# EasyEDA Pro project EVA_RT.eprj, board EVA_RT_PCB
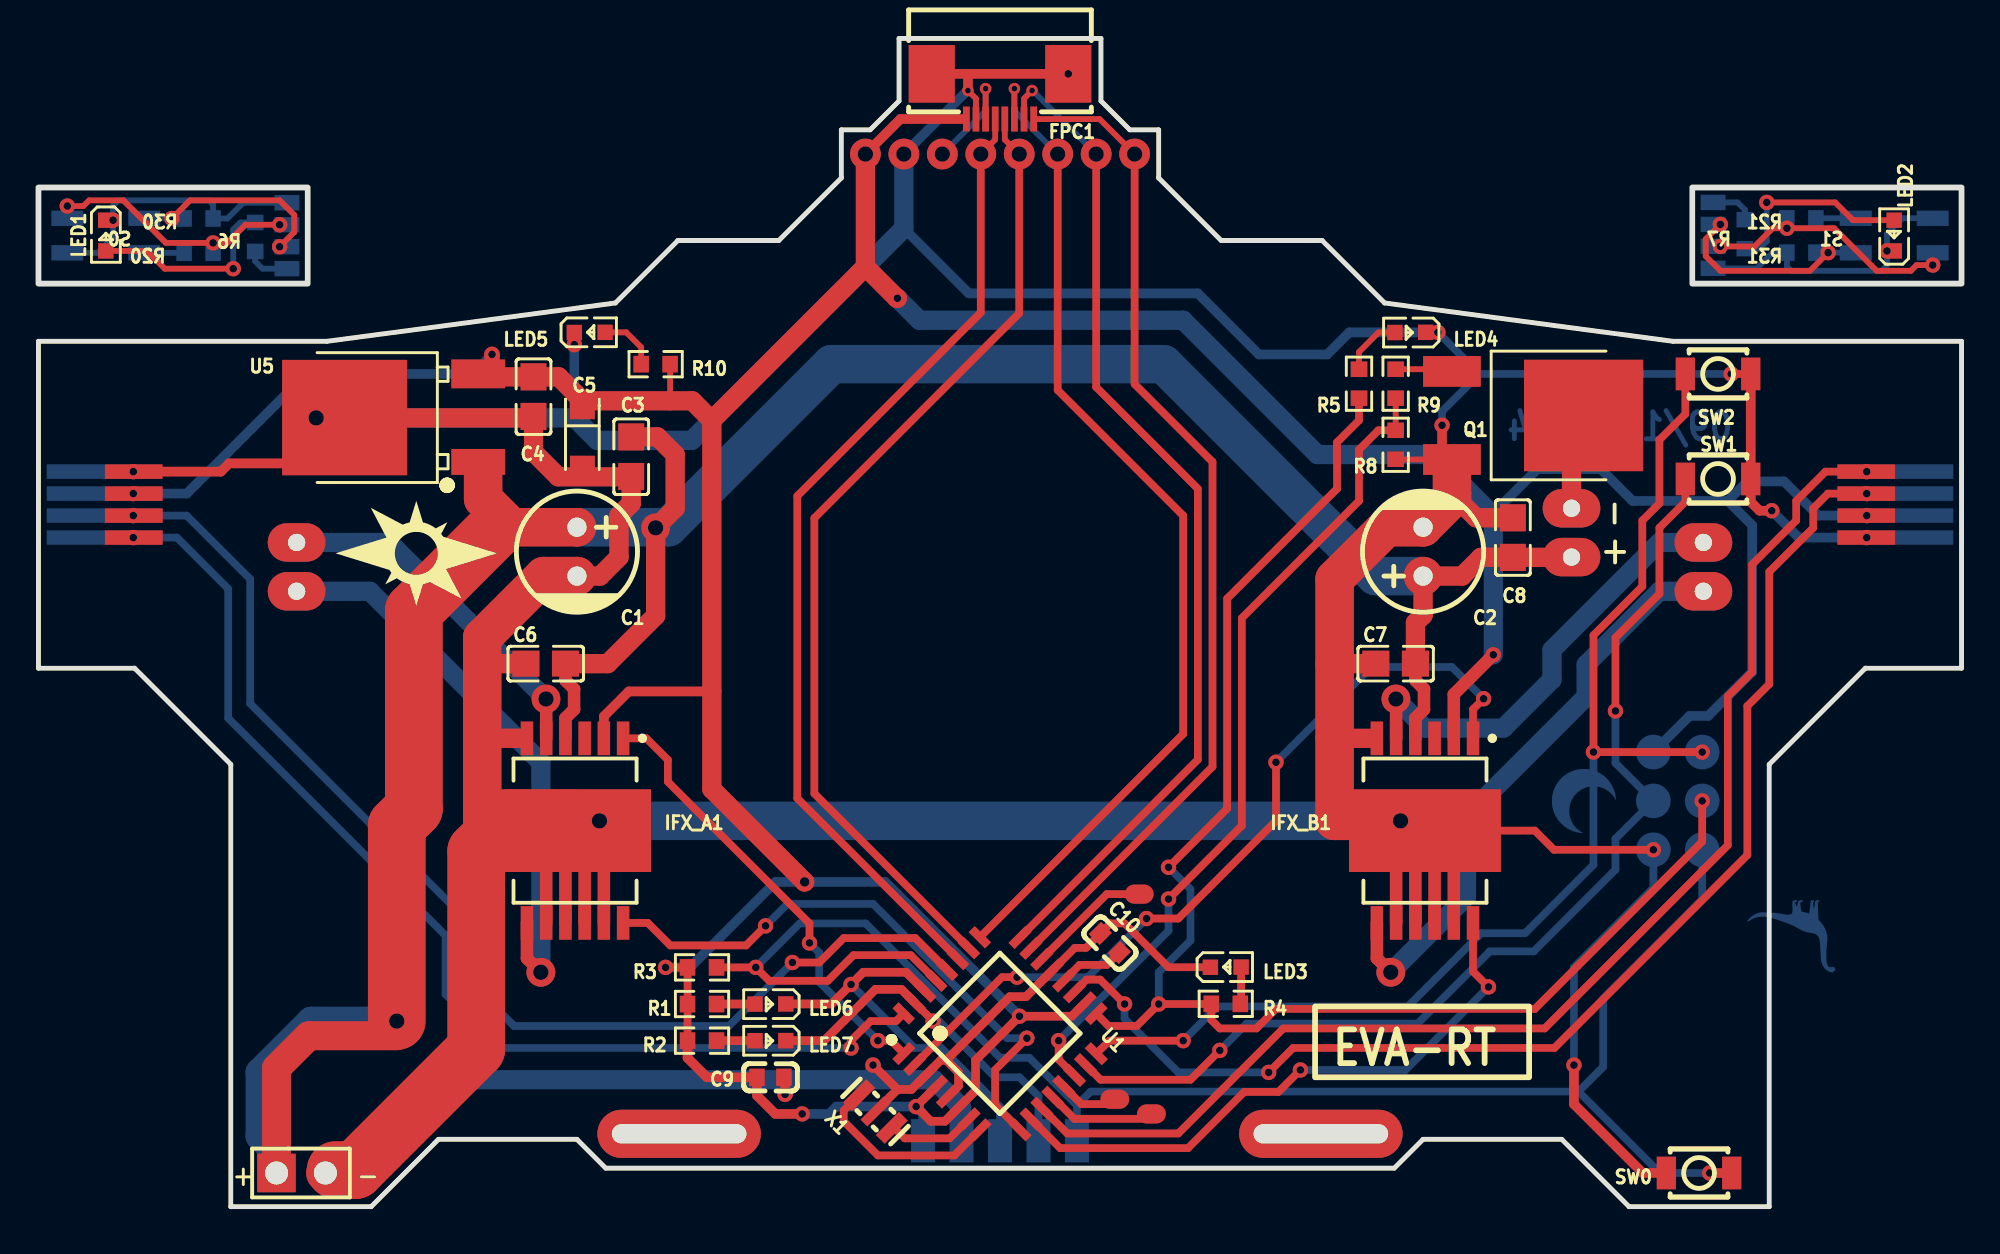
[diagram p12: board, top side]
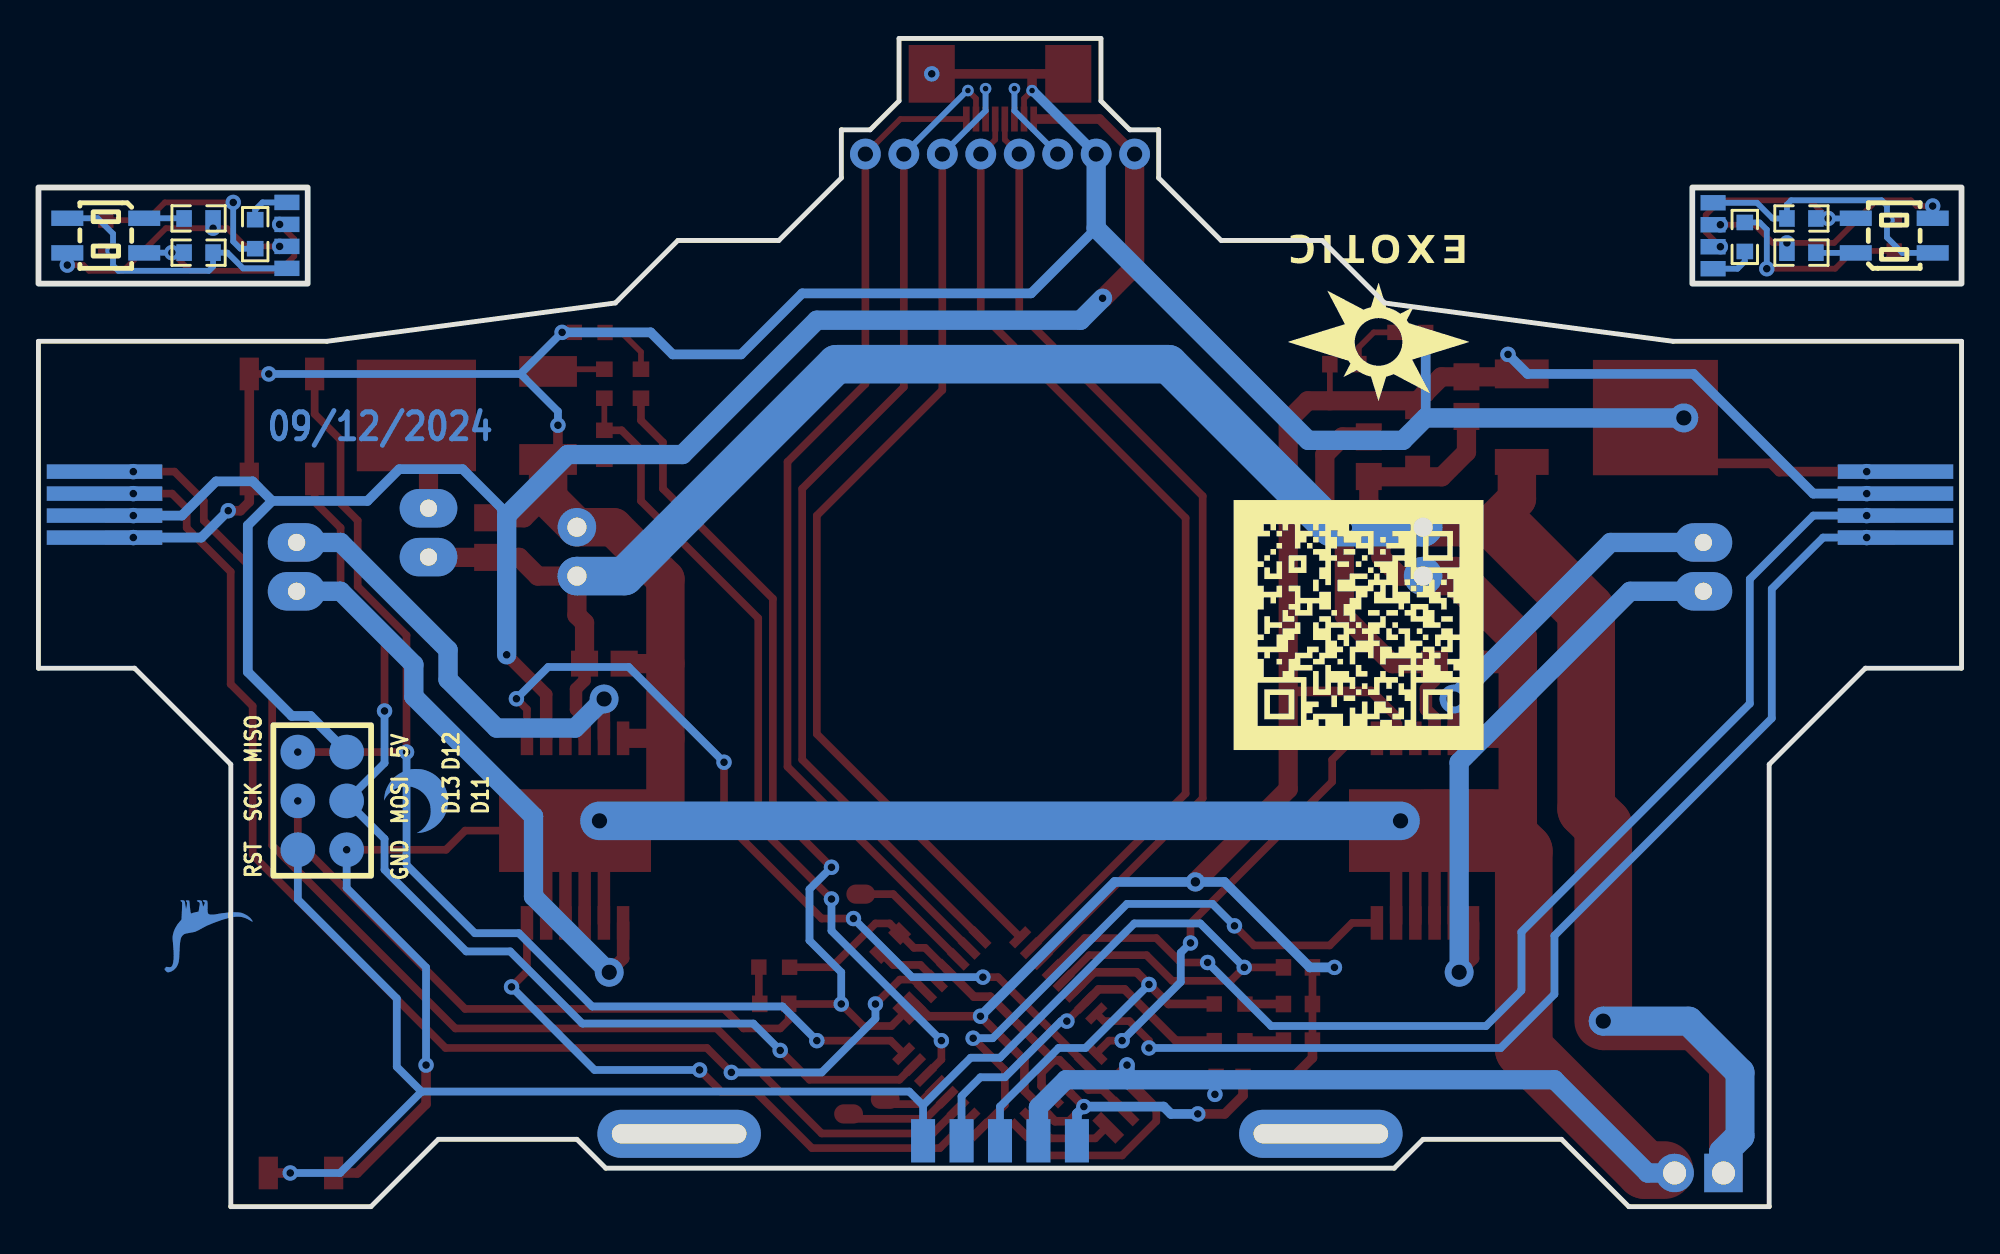
[diagram p13: board, bottom side, seen from below]

Outline 100 x 60.75 mm; copper layers: Top Layer, Bottom Layer. Coordinates in mm from the lower left corner of the outline.
Outline path: rectangle 0,53 14,48 ; rectangle 100,48 86,53 ; 0,45 15,45 30,46.99 33.25,50.24 38.5,50.24 41.75,53.49 41.75,56 43.25,56 44.75,57.5 44.75,60.75 55.25,60.75 55.25,57.5 56.75,56 58.25,56 58.25,53.49 61.5,50.24 66.75,50.24 70,46.99 85,45 100,45 100,28 95,28 90,23 90,0 82.71,0 79.21,3.5 72,3.5 70.5,2 29.5,2 28,3.5 20.8,3.5 17.3,0 10,0 10,23 5,28 0,28 0,45
Stack: Top Layer 0.035mm - / Dielectric2 1.51mm FR4 er 4.5 / Bottom Layer 0.035mm -

## Design rules (mm)
template: Custom Config
spacing copperThickness1oz (default): track to track 0.102, other pairs 0.152 to 0.3
spacing copperThickness2oz: track to track 0.203, other pairs 0.152 to 0.3
track width copperThickness1oz (default): min 0.127, default 0.254, max 3
track width copperThickness2oz: min 0.203, default 0.254, max 2.54
differential pair differentialPair (default): width min 0.127, default 0.254, max 2.54; gap min 0.152, default 0.152
via viaSize (default): diameter min 0.5, default 0.61, max 10; hole min 0.3, default 0.305, max 6.3

## Placement (name value [footprint] x y rotation side)
C1  220uF  [cap-th_bd6.3-p2.50-d1.0-fd]  28 34.06 270 top
C2  220uF  [cap-th_bd6.3-p2.50-d1.0-fd]  72 34.06 90 top
C3  220nF  [C0805]  30.82 39 90 top
C4  100nF  [C0805]  25.74 42.12 90 top
C5  47uF  [cap-smd_l3.2-w1.6-rd]  28.28 40 270 top
C6  100nF  [C0805]  26.38 28.24 0 top
C7  100nF  [C0805]  70.57 28.24 0 top
C8  100nF  [C0805]  76.67 34.79 270 top
C9  100nF  [C0603]  38.06 6.73 180 top
C10  100nF  [C0603]  55.72 13.71 135 top
FPC1  FFC05001-08SBA124W5M  [FFC-SMD_FFC05001-08SBA124W5M]  50 57.73 180 top
IFX_A1  -  [PG-DSO-12-17]  27.9 19.55 270 top
IFX_B1  -  [PG-DSO-12-17]  72.1 19.55 270 top
LED1  XL-1608SURC-06  [LED0603-RD_RED]  3.5 50.5 270 top
LED2  XL-1608SURC-06  [LED0603-RD_RED]  96.5 50.5 90 top
LED3  XL-1608SURC-06  [LED0603-RD_RED]  61.74 12.45 0 top
LED4  XL-1608SURC-06  [LED0603-RD_RED]  71.34 45.46 180 top
LED5  XL-1608SURC-06  [LED0603-RD_RED]  28.66 45.46 0 top
LED6  XL-1608SURC-06  [LED0603-RD_RED]  38.06 10.54 180 top
LED7  XL-1608SURC-06  [LED0603-RD_RED]  38.06 8.63 180 top
NOREF  -  [Pad_e1501]  96.57 35.94 90 top
NOREF#2  -  [Pad_e285]  83.97 23.64 0 top
NOREF#3  -  [Pad_e92]  4.96 37.08 90 top
NOREF#4  -  [Pad_e1096]  87.08 51.08 90 top
NOREF#5  -  [Pad_e19]  52 3.43 0 top
NOREF#6  -  [Pad_e7]  48 3.43 0 top
NOREF#7  -  [Pad_e48]  95.04 34.79 90 top
NOREF#8  -  [Pad_e89]  95.04 35.94 90 top
NOREF#9  -  [Pad_e174]  79.72 36.32 0 top
NOREF#10  -  [Pad_e1503]  96.57 38.22 90 top
NOREF#11  -  [Pad_e747]  86.58 32 0 top
NOREF#12  -  [Pad_e8]  46 3.43 0 top
NOREF#13  -  [Pad_e164]  79.72 33.78 0 top
NOREF#14  -  [Pad_e746]  86.58 34.54 0 top
NOREF#15  -  [Pad_e284]  83.97 21.1 180 top
NOREF#16  -  [Pad_e5]  66.69 3.79 270 top
NOREF#17  -  [Pad_e91]  4.96 38.22 90 top
NOREF#18  -  [Pad_e280]  86.51 23.64 180 top
NOREF#19  -  [Pad_e46]  95.04 37.08 90 top
NOREF#20  -  [Pad_e34]  54 3.43 0 top
NOREF#21  -  [Pad_e1018]  12.92 48.78 270 top
NOREF#22  -  [Pad_e1500]  96.57 34.79 90 top
NOREF#23  -  [Pad_e1149]  87.08 48.79 90 top
NOREF#24  -  [Pad_e535]  57.24 16.25 90 top
NOREF#25  -  [Pad_e16]  50 3.43 0 top
NOREF#26  -  [Pad_e98]  3.43 37.08 90 top
NOREF#27  -  [Pad_e93]  4.96 35.94 90 top
NOREF#28  -  [Pad_e1502]  96.57 37.08 90 top
NOREF#29  -  [Pad_e282]  86.51 18.56 180 top
NOREF#30  -  [Pad_e713]  57.87 4.82 90 top
NOREF#31  -  [Pad_e868]  13.42 32 180 top
NOREF#32  -  [Pad_e712]  55.97 5.58 90 top
NOREF#33  -  [Pad_e1021]  12.92 52.21 270 top
NOREF#34  -  [Pad_e96]  3.43 34.79 90 top
NOREF#35  -  [Pad_e869]  13.42 34.54 180 top
NOREF#36  -  [Pad_e1094]  87.08 52.22 90 top
NOREF#37  -  [Pad_e281]  86.51 21.1 90 top
NOREF#38  -  [Pad_e283]  83.97 18.56 180 top
NOREF#39  -  [Pad_e45]  95.04 38.22 90 top
NOREF#40  -  [Pad_e13]  33.31 3.79 270 top
NOREF#41  -  [Pad_e100]  3.43 38.22 90 top
NOREF#42  -  [Pad_e1028]  12.92 49.92 270 top
NOREF#43  -  [Pad_e97]  3.43 35.94 90 top
NOREF#44  -  [Pad_e90]  4.96 34.79 90 top
NOREF#45  -  [Pad_e1095]  87.08 49.94 90 top
NOREF#46  -  [Pad_e1027]  12.92 51.06 270 top
Q1  IRFR3411TR-VB  [TO-252-2_L6.6-W6.1-P4.57-LS9.9-BR-CW]  76.92 41.14 180 top
R1  1kΩ  [R0603]  34.51 10.54 0 top
R2  1kΩ  [R0603]  34.51 8.63 0 top
R3  1kΩ  [R0603]  34.51 12.44 0 top
R4  1kΩ  [R0603]  61.74 10.55 0 top
R5  1kΩ  [R0603]  68.67 42.8 90 top
R6  1kΩ  [R0603]  11.27 50.43 90 bottom
R7  1kΩ  [R0603]  88.73 50.57 270 bottom
R8  10kΩ  [R0603]  70.57 39.62 270 top
R9  200Ω  [R0603]  70.57 42.8 270 top
R10  1kΩ  [R0603]  32.09 43.81 0 top
R20  100Ω  [R0603]  8.33 49.61 180 bottom
R21  100Ω  [R0603]  91.67 51.39 0 bottom
R30  47kΩ  [R0603]  8.33 51.39 180 bottom
R31  47kΩ  [R0603]  91.67 49.61 0 bottom
S0  QRE1113GR  [OPTO-SMD_QRE1113GR]  3.5 50.5 180 bottom
S1  QRE1113GR  [OPTO-SMD_QRE1113GR]  96.5 50.5 0 bottom
SW0  B3U-1000P  [key-smd_b3u-1000pm]  86.35 1.75 180 top
SW1  B3U-1000P  [key-smd_b3u-1000pm]  87.34 37.84 0 top
SW2  B3U-1000P  [key-smd_b3u-1000pm]  87.34 43.3 0 top
U1  ATMEGA328P-AU  [tqfp-32_l7.0-w7.0-p0.80-ls9.0-bl]  50 9 315 top
U5  78M05  [TO-252-2_L6.5-W6.1-P4.58-LS10.0-TL]  19.39 41.02 180 top
VIN  KH-2.54PH180-1X2P-L11.5  [hdr-th_2p-p2.54-v-m]  13.65 1.75 0 top
X1  16MHz  [OSC-SMD_3P-L3.2-W1.3-P1.2-L]  43.52 4.95 135 top

## Footprints (pads in the part's own frame, mm; a bottom-side part is the same pattern mirrored in y, then rotated)
C0603
  rect 0.8x0.9 smd: 1(-0.7,0) 2(0.7,0)
C0805
  rect 1.41x1.35 smd: 1(-1.03,0) 2(1.03,0)
cap-smd_l3.2-w1.6-rd
  rect 1x1.296 smd: 1(-1.449,0) 2(1.449,0)
cap-th_bd6.3-p2.50-d1.0-fd
  round 2 hole 1x0.9: 1(-1.27,0) 2(1.27,0)
FFC-SMD_FFC05001-08SBA124W5M
  rect 0.35x1.3 smd: 1(1.75,1.175) 2(1.25,1.175) 3(0.75,1.175) 4(0.25,1.175) 5(-0.25,1.175) 6(-0.75,1.175) 7(-1.25,1.175) 8(-1.75,1.175)
  rect 2.4x3 smd: 9(-3.55,-1.175) 10(3.55,-1.175)
hdr-th_2p-p2.54-v-m
  rect 2x2 hole 1.2x0.9: 1(-1.27,0)
  round 2 hole 1.2x0.9: 2(1.27,0)
key-smd_b3u-1000pm
  rect 1x1.7 smd: 1(-1.7,0) 2(1.7,0)
LED0603-RD_RED
  rect 0.8x0.8 smd: 1(-0.799,-0.004) 2(0.799,0.004)
OPTO-SMD_QRE1113GR
  rect 1.66x0.8 smd: 1(-2,-0.9) 2(2,-0.9) 3(2,0.9) 4(-2,0.9)
OSC-SMD_3P-L3.2-W1.3-P1.2-L
  rect 0.65x1.7 smd: 1(-1.2,0) 3(1.2,0)
  rect 0.5x1.7 smd: 2(0,0)
Pad_e5
  oval 2.5x8.5 hole 1x7: 1(0,0)
Pad_e7
  rect 1.25x2.25 smd far side: 33(0,0)
Pad_e8
  rect 1.25x2.25 smd far side: 33(0,0)
Pad_e13
  oval 2.5x8.5 hole 1x7: 1(0,0)
Pad_e16
  rect 1.25x2.25 smd far side: 33(0,0)
Pad_e19
  rect 1.25x2.25 smd far side: 33(0,0)
Pad_e34
  rect 1.25x2.25 smd far side: 33(0,0)
Pad_e45
  rect 0.75x3 smd: 1(0,0)
Pad_e46
  rect 0.75x3 smd: 1(0,0)
Pad_e48
  rect 0.75x3 smd: 1(0,0)
Pad_e89
  rect 0.75x3 smd: 1(0,0)
Pad_e90
  rect 0.75x3 smd: 1(0,0)
Pad_e91
  rect 0.75x3 smd: 1(0,0)
Pad_e92
  rect 0.75x3 smd: 1(0,0)
Pad_e93
  rect 0.75x3 smd: 1(0,0)
Pad_e96
  rect 0.75x6 smd far side: 1(0,0)
Pad_e97
  rect 0.75x6 smd far side: 1(0,0)
Pad_e98
  rect 0.75x6 smd far side: 1(0,0)
Pad_e100
  rect 0.75x6 smd far side: 1(0,0)
Pad_e164
  oval 3x2 hole 0.9: 1(0,0)
Pad_e174
  oval 3x2 hole 0.9: 1(0,0)
Pad_e280
  round 1.8 smd far side: 1(0,0)
Pad_e281
  round 1.8 smd far side: 1(0,0)
Pad_e282
  round 1.8 smd far side: 1(0,0)
Pad_e283
  round 1.8 smd far side: 1(0,0)
Pad_e284
  round 1.8 smd far side: 1(0,0)
Pad_e285
  round 1.8 smd far side: 1(0,0)
Pad_e535
  oval 1x1.5 smd: 1(0,0)
Pad_e712
  oval 1x1.5 smd: 1(0,0)
Pad_e713
  oval 1x1.5 smd: 1(0,0)
Pad_e746
  oval 3x2 hole 0.9: 1(0,0)
Pad_e747
  oval 3x2 hole 0.9: 1(0,0)
Pad_e868
  oval 3x2 hole 0.9: 1(0,0)
Pad_e869
  oval 3x2 hole 0.9: 1(0,0)
Pad_e1018
  rect 0.8x1.3 smd far side: 1(0,0)
Pad_e1021
  rect 0.8x1.3 smd far side: 1(0,0)
Pad_e1027
  rect 0.8x1.3 smd far side: 1(0,0)
Pad_e1028
  rect 0.8x1.3 smd far side: 1(0,0)
Pad_e1094
  rect 0.8x1.3 smd far side: 1(0,0)
Pad_e1095
  rect 0.8x1.3 smd far side: 1(0,0)
Pad_e1096
  rect 0.8x1.3 smd far side: 1(0,0)
Pad_e1149
  rect 0.8x1.3 smd far side: 1(0,0)
Pad_e1500
  rect 0.75x6 smd far side: 1(0,0)
Pad_e1501
  rect 0.75x6 smd far side: 1(0,0)
Pad_e1502
  rect 0.75x6 smd far side: 1(0,0)
Pad_e1503
  rect 0.75x6 smd far side: 1(0,0)
PG-DSO-12-17
  rect 1.75x0.65 smd: 1(-4.8,2.5) 2(-4.8,1.5) 3(-4.8,0.5) 4(-4.8,-0.5) 5(-4.8,-1.5) 6(-4.8,-2.5) 7(4.8,-2.5) 8(4.8,-1.5) 9(4.8,-0.5) 10(4.8,0.5) 11(4.8,1.5) 12(4.8,2.5)
  rect 4.3x7.9 smd: 13(0,0)
R0603
  rect 0.806x0.864 smd: 1(-0.753,0) 2(0.753,0)
TO-252-2_L6.5-W6.1-P4.58-LS10.0-TL
  rect 2.8x1.35 smd: 1(-3.475,2.29)
  rect 2.8x1.5 smd: 3(-3.475,-2.29)
  rect 6.5x6 smd: 4(3.475,-0.017)
TO-252-2_L6.6-W6.1-P4.57-LS9.9-BR-CW
  rect 3x1.6 smd: 1(3.424,-2.29) 3(3.424,2.29)
  rect 6.2x5.8 smd: 2(-3.424,0)
tqfp-32_l7.0-w7.0-p0.80-ls9.0-bl
  rect 0.45x1.25 smd: 1(-2.8,-4.269) 2(-2,-4.269) 3(-1.2,-4.269) 4(-0.4,-4.269) 5(0.4,-4.269) 6(1.2,-4.269) 7(2,-4.269) 8(2.8,-4.269) 17(2.8,4.269) 18(2,4.269) 19(1.2,4.269) 20(0.4,4.269) 21(-0.4,4.269) 22(-1.2,4.269) 23(-2,4.269) 24(-2.8,4.269)
  rect 1.25x0.45 smd: 9(4.282,-2.8) 10(4.282,-2) 11(4.282,-1.2) 12(4.282,-0.4) 13(4.282,0.4) 14(4.282,1.2) 15(4.282,2) 16(4.282,2.8)
  rect 1.2x0.45 smd: 25(-4.281,2.8) 26(-4.281,2) 27(-4.281,1.2) 28(-4.281,0.4) 29(-4.281,-0.4) 30(-4.281,-1.2) 31(-4.281,-2) 32(-4.281,-2.8)

## Nets
+5V: C4.2 C5.1 C9.2 FPC1.1 IFX_A1.2 IFX_B1.2 NOREF.1 NOREF#2.1 NOREF#3.1 NOREF#8.1 NOREF#12.33 NOREF#26.1 NOREF#45.1 NOREF#46.1 R1.1 R2.1 R3.1 R10.2 R20.1 R21.1 S0.3 S1.3 U1.4 U1.6 U1.18 U5.3
GND: C1.2 C2.2 C3.1 C4.1 C5.2 C6.1 C7.1 C8.1 C9.1 C10.2 FPC1.2 FPC1.9 FPC1.10 IFX_A1.6 IFX_A1.8 IFX_A1.9 IFX_A1.10 IFX_A1.11 IFX_A1.13 IFX_B1.6 IFX_B1.8 IFX_B1.9 IFX_B1.10 IFX_B1.11 IFX_B1.13 LED1.1 LED2.1 LED3.1 LED4.1 LED5.1 NOREF#6.33 NOREF#7.1 NOREF#17.1 NOREF#22.1 NOREF#23.1 NOREF#33.1 NOREF#38.1 NOREF#41.1 Q1.3 R8.2 R30.1 R31.1 S0.2 S1.2 SW0.2 SW1.2 SW2.2 U1.3 U1.5 U1.21 U5.4 VIN.2 X1.2
VCC: C1.1 C2.1 C3.2 C6.2 C7.2 C8.2 IFX_A1.4 IFX_B1.4 NOREF#13.1 U5.1 VIN.1
$C10_1: C10.1 U1.20
$LED1_2: LED1.2 R6.2
$LED2_2: LED2.2 R7.2
$LED3_2: LED3.2 R4.2
$LED4_2: LED4.2 R5.2
$LED5_2: LED5.2 R10.1
$LED6_2: LED6.2 R1.2
$LED7_2: LED7.2 R2.2
$Q1_1: Q1.1 R9.1
$R20_2: R20.2 S0.1
$R21_2: R21.2 S1.1
$U1_7: U1.7 X1.1
$U1_8: U1.8 X1.3
B1/D11: NOREF#15.1 SW1.1 U1.15
B2/D12: NOREF#18.1 SW2.1 U1.16
C0/A4: FPC1.4 U1.27
DIRA/D3: IFX_A1.1 U1.1
DIRB/D4: IFX_B1.1 U1.2
LED1/D2: NOREF#21.1 NOREF#34.1 NOREF#44.1 R6.1 U1.32
LED2/D7: NOREF#10.1 NOREF#36.1 NOREF#39.1 R7.1 U1.11
LED3/D13: NOREF#37.1 R4.1 R5.1 U1.17
OUT_A1: IFX_A1.5 NOREF#35.1
OUT_A2: IFX_A1.7 NOREF#31.1
OUT_B1: IFX_B1.5 NOREF#14.1
OUT_B2: IFX_B1.7 NOREF#11.1
OUT_C: NOREF#9.1 Q1.2
P3: FPC1.3
PWMA/D5: IFX_A1.12 U1.9
PWMB/D6: IFX_B1.12 U1.10
PWMC/D10: R8.1 R9.2 U1.14
RESET: NOREF#20.33 NOREF#29.1 R3.2 SW0.1 U1.29
RX/D0: LED6.1 NOREF#25.33 U1.30
S0/A0: FPC1.8 U1.23
S1/A1: FPC1.7 U1.24
S2/A2: FPC1.6 U1.25
S3/A3: FPC1.5 U1.26
TX/D1: LED7.1 NOREF#5.33 U1.31
Y0/A5: NOREF#27.1 NOREF#42.1 NOREF#43.1 R30.2 S0.4 U1.28
Y1/A6: NOREF#4.1 NOREF#19.1 NOREF#28.1 R31.2 S1.4 U1.19

Pads without a net: IFX_A1 3; IFX_B1 3; NOREF#16 1; NOREF#24 1; NOREF#30 1; NOREF#32 1; NOREF#40 1; U1 12 13 22

## Via types
v1: diameter 0.8, hole 0.4, Top Layer to Bottom Layer, 67 vias
v2: diameter 1.6, hole 0.8, Top Layer to Bottom Layer, 8 vias
v3: diameter 0.6, hole 0.3, Top Layer to Bottom Layer, 4 vias
v4: diameter 1.5, hole 0.8, Top Layer to Bottom Layer, 9 vias
v5: diameter 1, hole 0.5, Top Layer to Bottom Layer, 1 via

## Routing (per net, layer and track width the routed paths; a pad name or vN(x,y) marks a point on that pad's centre or on a via; arc(x,y) is an arc through that point)
+5V: length 268.6
  Top Layer w0.3: v1(98.5,48.97) 97.66,48.97 97.37,48.67 95.59,48.67 93.37,50.88 v1(90.92,50.88) 90.18,50.88 89.24,49.94 v1(87.46,49.94) ; v1(12.54,51.06) 10.76,51.06 9.82,50.12 v1(9.08,50.12) 6.63,50.12 4.41,52.33 2.63,52.33 2.34,52.03 v1(1.5,52.03) ; 32.85,41.91 R10.2
  Top Layer w0.4: v1(32.61,12.44) R3.1 R1.1 R2.1
  Top Layer w0.45: U1.4 v1(45.64,5.2) 46.4,4.44 47.14,4.44 U1.6 48.73,6.03 48.73,7.62 v1(51.02,9.9) 53.73,9.9 54.38,10.56
  Top Layer w0.5: IFX_A1.2 29.4,25.5 30.7,26.79 35.01,26.79 ; 48.12,56.56 44.82,56.56 v2(43,54.74) ; v1(39.71,4.82) 38.32,4.82 37.36,5.78 C9.2 34.76,6.73 33.75,7.73 R2.1
  Top Layer w0.65: IFX_B1.2 73.6,26.64 v1(75.65,28.7)
  Top Layer w0.8: v1(23.58,44.32) 23.58,43.31
  Top Layer w1: 35.01,40.89 35.01,21.71 v5(39.84,16.89) ; 35.01,40.89 34,41.91 28.28,41.91 ; 35.01,40.89 43,48.88 ; 43,48.88 v2(43,54.74) ; 43,48.88 44.64,47.24 v1(44.67,47.24) ; 28.28,41.91 C5.1 ; 28.28,41.91 27.9,42.29 27.9,42.3 27.05,43.15 C4.2 22.87,43.15
  Bottom Layer w0.5: NOREF.1 v1(95.07,35.94) 92.54,35.94 90.77,37.72 88.86,37.72 87.85,36.7 ; NOREF#2.1 85.85,25.52 86.82,25.52 89.12,27.81 89.12,35.43 87.85,36.7 ; 87.85,36.7 82.89,36.7 81.24,38.35 77.94,38.35 75.91,36.32 75.91,36.19 ; v1(39.71,4.82) 41.11,4.82 41.49,5.2 v1(45.64,5.2) 46,4.84 46,3.17 ; v1(51.02,9.9) 44.03,16.89 v5(39.84,16.89) 38.33,16.89 33.89,12.44 v1(32.61,12.44) ; v1(23.58,44.32) 22.57,43.3 13.93,43.3 7.71,37.08 v1(4.93,37.08)
  Bottom Layer w1: v1(44.67,47.24) 45.81,46.1 59.53,46.1 66.51,39.11 72.48,39.11 75.65,35.94 v1(75.65,28.7)
GND: length 454.2
  Top Layer w0.254: R8.2 70.57,38.85
  Top Layer w0.3: v3(48.33,58.04) 48.75,57.62 FPC1.2 ; 70.57,38.85 72.99,38.85
  Top Layer w0.4: IFX_B1.13 77.81,19.55 78.81,18.56 v1(83.97,18.56) ; v1(88.02,43.3) SW2.2 ; 60.94,12.45 58.76,12.45 56.48,14.73 55.74,14.73 54.47,13.46 53.89,13.46 52.81,12.37
  Top Layer w0.45: 47.19,5.63 47.84,6.28 47.84,6.98 47.21,7.62 ; 44.67,6.09 X1.2 ; 44.67,6.09 45.4,6.09 U1.3 46.92,7.62 47.21,7.62 ; 44.67,6.09 v1(43.4,7.36) ; 47.21,7.62 50.51,10.92 51.35,10.92 52.81,12.37
  Top Layer w0.5: 48.33,58.91 v1(53.55,58.91) ; 48.33,58.91 FPC1.10 ; 48.33,58.91 v3(48.33,58.04) ; v1(79.84,7.36) 79.84,5.33 83.43,1.75 SW0.2 ; NOREF#17.1 9.49,38.22 9.92,38.65 15.92,38.65 ; v1(90.13,36.19) 89.5,36.19 89.04,36.65 SW1.2 SW2.2 ; v1(38.82,5.84) 38.82,6.67 C9.1 ; Q1.3 72.99,38.85 v1(72.99,40.64)
  Top Layer w0.65: IFX_A1.8 26.4,18.05 27.4,19.05 IFX_A1.9 ; IFX_B1.9 71.6,19.05 70.6,18.05 IFX_B1.8 ; IFX_B1.11 73.6,18.05 72.6,19.05 IFX_B1.10 ; IFX_A1.11 29.4,18.05 28.4,19.05 IFX_A1.10
  Top Layer w1: v4(14.44,41.02) 25.67,41.02 25.68,41.03 ; C1.2 29.2,32.79 30.19,33.78 30.19,35.94 30.82,36.57 30.82,37.95 27.03,37.95 25.74,39.24 C4.1 ; C6.1 23.08,28.24 ; 67.4,28.24 C7.1 ; C8.1 74.76,35.82 73.5,37.08 ; 69.34,24.35 67.4,24.35 ; 25.15,24.35 23.08,24.35
  Top Layer w2: 23.08,19.34 23.08,29.59 26.28,32.79 C1.2 ; 73.5,38.6 73.5,36.83 C2.2 70.1,35.33 67.4,32.64 67.4,20.06 v4(70.83,20.06)
  Top Layer w3: 15.45,1.9 16.47,1.9 22.76,8.19 22.76,18.48 24.47,20.19 27.9,20.19
  Bottom Layer w0.3: S1.2 96.92,51.4 96.12,50.6 v1(96.12,49.7) 96.12,48.95 95.84,48.67 91.14,48.67 90.92,48.89 R31.1 90.17,49.61 89.36,48.79 NOREF#23.1 ; S0.2 3.08,49.6 3.88,50.4 v1(3.88,51.3) 3.88,52.05 4.16,52.33 8.86,52.33 9.08,52.11 R30.1 9.83,51.39 10.64,52.21 NOREF#33.1
  Bottom Layer w0.4: v1(79.84,7.36) 79.84,12.44 83.97,16.57 v1(83.97,18.56) ; 74.93,43.3 72.99,41.36 v1(72.99,40.64) ; 74.93,43.3 v1(88.02,43.3) ; 74.93,43.3 v1(72.77,45.47) ; v1(4.93,38.22) NOREF#41.1
  Bottom Layer w0.5: 45,50.88 48.38,47.49 60.29,47.49 63.46,44.32 67.02,44.32 68.16,45.47 v1(72.77,45.47) ; v2(45,54.74) 48.3,58.04 v3(48.33,58.04) ; v1(27.86,44.82) 27.86,41.03 ; v1(90.13,36.19) 91.53,34.79 v1(95.07,34.79) NOREF#22.1
  Bottom Layer w0.8: 43.4,6.6 v1(43.4,7.36)
  Bottom Layer w1: 48,3.17 48,5.17 46.57,6.6 21.17,6.6 16.32,1.75 VIN.2 ; v4(14.44,41.02) 27.85,41.02 27.86,41.03 29.05,39.85 33.97,39.85 45,50.88 v2(45,54.74)
  Bottom Layer w2: v4(29.17,20.06) v4(70.83,20.06)
VCC: length 138.7
  Top Layer w0.65: C6.2 27.41,27.36 27.85,26.92 27.85,25.85 27.4,25.4 IFX_A1.4 ; C7.2 71.6,27.36 72.05,26.92 72.05,25.85 71.6,25.4 IFX_B1.4
  Top Layer w1: C3.2 32.19,40.03 33.11,39.11 33.11,36.32 v4(32.09,35.3) 32.09,30.73 29.6,28.24 C6.2 ; C7.2 71.6,30.36 72,30.76 C2.1 74.03,32.79 75,33.76 C8.2 79.7,33.76 NOREF#13.1
  Top Layer w1.5: VIN.1 12.38,7.21 14.06,8.89 18.63,8.89 v4(18.63,9.65)
  Top Layer w2: C1.1 24.6,35.33 23.12,36.81 23.12,38.35
  Top Layer w3: 23.87,35.33 19.52,30.98 19.52,20.7 18.63,19.81 v4(18.63,9.65)
  Bottom Layer w2: C2.1 69.53,32.79 58.51,43.81 41.24,43.81 32.76,35.33 C1.1
(no net): length 14.7
  Top Layer w0.4: 55.46,5.33 54.24,5.33 U1.13 ; NOREF#30.1 57.62,4.57 53.87,4.57 U1.12 ; NOREF#24.1 55.56,16.25 U1.22
$C10_1: length 3.5
  Top Layer w0.4: U1.20 54.13,12.57 55.56,12.57 56.21,13.22
$LED1_2: length 10.3
  Top Layer w0.3: LED1.2 5.65,49.7 6.57,48.78 v1(10.13,48.78)
  Bottom Layer w0.3: v1(10.13,48.78) 10.13,50.81 10.5,51.18 R6.2
$LED2_2: length 10.3
  Top Layer w0.3: v1(89.87,52.22) 93.43,52.22 94.35,51.3 LED2.2
  Bottom Layer w0.3: R7.2 89.5,49.82 89.87,50.19 v1(89.87,52.22)
$LED3_2: length 1.9
  Top Layer w0.4: LED3.2 62.54,10.59 R4.2
$LED4_2: length 3.2
  Top Layer w0.3: LED4.2 69.68,45.46 68.67,44.45 R5.2
$LED5_2: length 3.1
  Top Layer w0.3: LED5.2 30.57,45.47 31.34,44.69 R10.1
$LED6_2: length 2
  Top Layer w0.45: LED6.2 37.26,10.54 R1.2
$LED7_2: length 2
  Top Layer w0.45: LED7.2 37.26,8.63 R2.2
$Q1_1: length 3
  Top Layer w0.3: Q1.1 73.39,43.55 R9.1
$R20_2: length 2.1
  Bottom Layer w0.3: R20.2 7.56,49.6 S0.1
$R21_2: length 2.1
  Bottom Layer w0.3: S1.1 92.44,51.4 R21.2
$U1_7: length 4.5
  Top Layer w0.4: 44.5,4.1 45.05,3.55 47.38,3.55 U1.7
$U1_8: length 10.1
  Top Layer w0.4: U1.8 47.62,2.66 43.65,2.66 41.87,4.44 41.87,5 X1.3
B1/D11: length 55.9
  Top Layer w0.4: SW1.1 85.64,36.65 84.29,35.3 84.29,31.87 82,29.59 v1(82,25.78) ; U1.15 55.23,6.6 59.91,6.6 v1(61.43,8.12)
  Bottom Layer w0.4: v1(61.43,8.12) 62.83,9.52 71.72,9.52 75.47,13.27 77.75,13.27 82,17.52 82,19.13 NOREF#15.1 82,23.07 v1(82,25.78)
B2/D12: length 63.1
  Top Layer w0.4: v1(59.53,8.63) 55.69,8.63 U1.16 ; v1(86.51,23.64) v1(80.86,23.64) 80.86,29.71 83.4,32.25 83.4,35.68 84.29,36.57 84.29,39.87 85.64,41.22 SW2.1
  Bottom Layer w0.4: v1(80.86,23.64) 80.86,17.78 77.31,14.22 75.02,14.22 71.21,10.41 61.3,10.41 v1(59.53,8.63)
C0/A4: length 51.4
  Top Layer w0.3: FPC1.4 49.75,55.49 v2(49,54.74)
  Top Layer w0.4: U1.27 39.46,21.24 39.46,36.95 49,46.49 v2(49,54.74)
DIRA/D3: length 23.5
  Top Layer w0.4: U1.1 44.33,8.63 v1(43.65,8.63) ; 30.41,24.35 31.61,24.35 32.73,23.24 32.73,22.09 40.09,14.73 v1(40.09,13.71)
  Bottom Layer w0.4: v1(40.09,13.71) 40.6,13.2 40.6,11.68 v1(43.65,8.63)
DIRB/D4: length 42.9
  Top Layer w0.4: U1.2 50.11,11.93 v1(50.89,11.93) ; v1(75.15,26.41) 74.6,25.86 IFX_B1.1 ; v1(57.62,14.98) 59.27,14.98 64.35,20.06 v1(64.35,23.11)
  Bottom Layer w0.4: v1(75.15,26.41) 73.5,28.06 69.3,28.06 v1(64.35,23.11) ; v1(50.89,11.93) 54.57,11.93 v1(57.62,14.98)
LED1/D2: length 61.6
  Top Layer w0.4: v1(42.25,8.25) 42.25,8.63 43.27,9.65 44.59,9.65 U1.32
  Bottom Layer w0.3: R6.1 11.27,49.16 11.65,48.78 NOREF#21.1
  Bottom Layer w0.4: v1(42.25,8.25) 23.97,8.25 21.17,11.05 21.17,14.09 9.87,25.4 9.87,32.13 7.2,34.79 v1(4.93,34.79) NOREF#34.1
LED2/D7: length 68.4
  Top Layer w0.4: v1(95.07,38.22) 92.93,38.22 91.4,36.7 91.4,35.68 89.12,33.4 89.12,27.81 87.85,26.54 87.85,18.79 78.32,9.27 64.73,9.27 59.27,3.81 53.5,3.81 U1.11
  Bottom Layer w0.3: R7.1 88.73,51.84 88.35,52.22 NOREF#36.1
LED3/D13: length 76.2
  Top Layer w0.4: R5.1 68.67,40.89 67.53,39.75 67.53,37.33 61.81,31.62 61.81,20.7 v1(58.76,17.65) ; v1(86.51,21.1) 86.51,18.98 77.81,10.28 64.35,10.28 63.34,9.27 61.43,9.27 60.99,9.71 R4.1 60.98,10.54 v1(58.25,10.54) 57.11,9.39 55.64,9.39 U1.17
  Bottom Layer w0.4: v1(58.76,17.65) 59.91,16.51 59.91,13.84 58.25,12.19 v1(58.25,10.54)
OUT_A1: length 18.4
  Top Layer w0.65: 26.4,26.46 IFX_A1.5
  Bottom Layer w1: v4(26.39,26.4) 18.25,34.54 NOREF#35.1
OUT_A2: length 30.2
  Top Layer w0.65: v4(26.12,12.19) 25.4,12.91 IFX_A1.7
  Bottom Layer w1: v4(26.12,12.19) 26.12,23.11 17.23,32 NOREF#31.1
OUT_B1: length 23.6
  Top Layer w0.65: 70.6,26.46 IFX_B1.5
  Bottom Layer w1: NOREF#14.1 84.29,34.54 78.7,28.95 78.7,27.41 76.18,24.89 72.1,24.89 v4(70.59,26.4)
OUT_B2: length 30.7
  Top Layer w0.65: v4(70.32,12.19) 69.6,12.91 IFX_B1.7
  Bottom Layer w1: NOREF#11.1 84.29,32 80.48,28.19 80.48,26.52 74.26,20.3 74.26,16.12 v4(70.32,12.19)
OUT_C: length 5.1
  Top Layer w1: Q1.2 79.72,40.51 NOREF#9.1
P3: length 5.9
  Top Layer w0.3: v3(49.25,58.14) FPC1.3
  Bottom Layer w0.3: v2(47,54.74) 49.25,56.99 v3(49.25,58.14)
PWMA/D5: length 31.2
  Top Layer w0.4: v1(51.4,8.76) 49.75,7.11 49.75,5.29 U1.9 ; v1(37.81,14.6) 36.79,13.58 32.85,13.58 31.69,14.75 30.41,14.75
  Bottom Layer w0.4: v1(37.81,14.6) 38.95,15.74 43.4,15.74 50.38,8.76 v1(51.4,8.76)
PWMB/D6: length 31.5
  Top Layer w0.4: v1(75.4,11.43) 74.6,12.23 IFX_B1.12 ; U1.10 53.13,3.04 59.78,3.04 62.7,5.97 64.48,5.97 v1(65.62,7.11)
  Bottom Layer w0.4: v1(65.62,7.11) 71.08,7.11 v1(75.4,11.43)
PWMC/D10: length 43.4
  Top Layer w0.3: R8.1 R9.2
  Top Layer w0.4: v1(53.05,8.63) 53.05,7.65 53.95,6.75 ; R8.1 69.68,40.37 68.67,39.37 68.67,36.7 62.57,30.6 62.57,19.81 v1(58.76,16)
  Bottom Layer w0.4: v1(58.76,16) 58.76,14.35 v1(53.05,8.63)
RESET: length 87.8
  Top Layer w0.4: R3.2 v1(37.3,12.44) 38,11.74 41.05,11.74 42.38,13.08 45.36,13.08 U1.29
  Top Layer w0.5: v1(86.91,1.75) SW0.1
  Bottom Layer w0.4: 80.08,5.98 81.37,7.27 81.37,10.83 86.51,15.97 NOREF#29.1 ; 80.08,5.98 54.72,5.98 54,5.27 ; 80.08,5.98 84.31,1.75 v1(86.91,1.75) ; 54,5.27 54,3.17 ; 54,5.27 51.52,7.74 50,7.74 43.01,14.73 39.59,14.73 v1(37.3,12.44)
RX/D0: length 20.4
  Top Layer w0.45: U1.30 45.12,12.19 42.89,12.19 v1(42.25,11.55) 41.24,10.54 LED6.1
  Bottom Layer w0.4: 50,3.55 50,5.2 46.95,8.25 45.56,8.25 v1(42.25,11.55)
S0/A0: length 52.9
  Top Layer w0.3: FPC1.8 55.18,56.56 v2(57,54.74)
  Top Layer w0.4: U1.23 61.05,22.88 61.05,38.73 57,42.78 v2(57,54.74)
S1/A1: length 53.1
  Top Layer w0.3: 51.67,58.04 51.25,57.62 FPC1.7
  Top Layer w0.4: U1.24 60.29,23.25 60.29,37.33 55,42.62 v2(55,54.74)
  Bottom Layer w0.3: v3(51.67,58.04) 51.7,58.04 v2(55,54.74)
S2/A2: length 53.7
  Top Layer w0.3: v3(50.75,58.14) FPC1.6
  Top Layer w0.4: v2(53,54.74) 53,42.46 59.53,35.94 59.53,24.58 U1.25
  Bottom Layer w0.3: v3(50.75,58.14) 50.75,56.99 v2(53,54.74)
S3/A3: length 51.2
  Top Layer w0.3: v2(51,54.74) 50.25,55.49 FPC1.5
  Top Layer w0.4: v2(51,54.74) 51,46.46 40.35,35.81 40.35,21.48 U1.26
TX/D1: length 18.7
  Top Layer w0.4: U1.31 v1(46.52,9.65)
  Top Layer w0.45: U1.31 44.87,11.3 43.52,11.3 40.86,8.64 LED7.1
  Bottom Layer w0.4: 52,3.55 52,5.74 51.02,6.73 49.75,6.73 46.82,9.65 v1(46.52,9.65)
Y0/A5: length 72.6
  Top Layer w0.3: v1(6.94,51.39) 7.88,52.33 12.54,52.33 13.3,51.57 13.3,50.68 v1(12.54,49.92)
  Top Layer w0.4: U1.28 45.6,13.97 41.87,13.97 40.6,12.7 v1(39.21,12.7)
  Bottom Layer w0.3: R30.2 v1(6.94,51.39) 5.51,51.39 S0.4
  Bottom Layer w0.4: v1(39.21,12.7) 35.9,9.39 24.73,9.39 22.89,11.23 22.89,14.28 11.01,26.16 11.01,32.64 7.71,35.94 v1(4.93,35.94)
Y1/A6: length 76
  Top Layer w0.3: v1(87.46,51.08) 86.7,50.32 86.7,49.43 87.46,48.67 92.12,48.67 v1(93.06,49.61)
  Top Layer w0.4: U1.19 54.5,11.81 55.21,11.81 v1(56.48,10.54) ; v1(95.07,37.08) 93.05,37.08 92.29,36.32 92.29,35.3 90,33.02 90,27.17 88.86,26.03 88.86,18.28 78.83,8.25 65.24,8.25 v1(63.97,6.98)
  Bottom Layer w0.3: R31.2 v1(93.06,49.61) 94.49,49.61 S1.4
  Bottom Layer w0.4: v1(63.97,6.98) 59.27,6.98 56.48,9.78 v1(56.48,10.54)

Small or netless copper shapes (teardrops, artwork), in the pictures only: 2 on Bottom Layer

## Text on the board
Bottom Layer: 09/12/2024
Bottom Silkscreen Layer: D11 | D12 | D13 | 5V | MOSI | GND | MISO | SCK | RST
Top Silkscreen Layer: + | - | EVA-RT
